# EasyEDA Pro project project.epro, board PCB
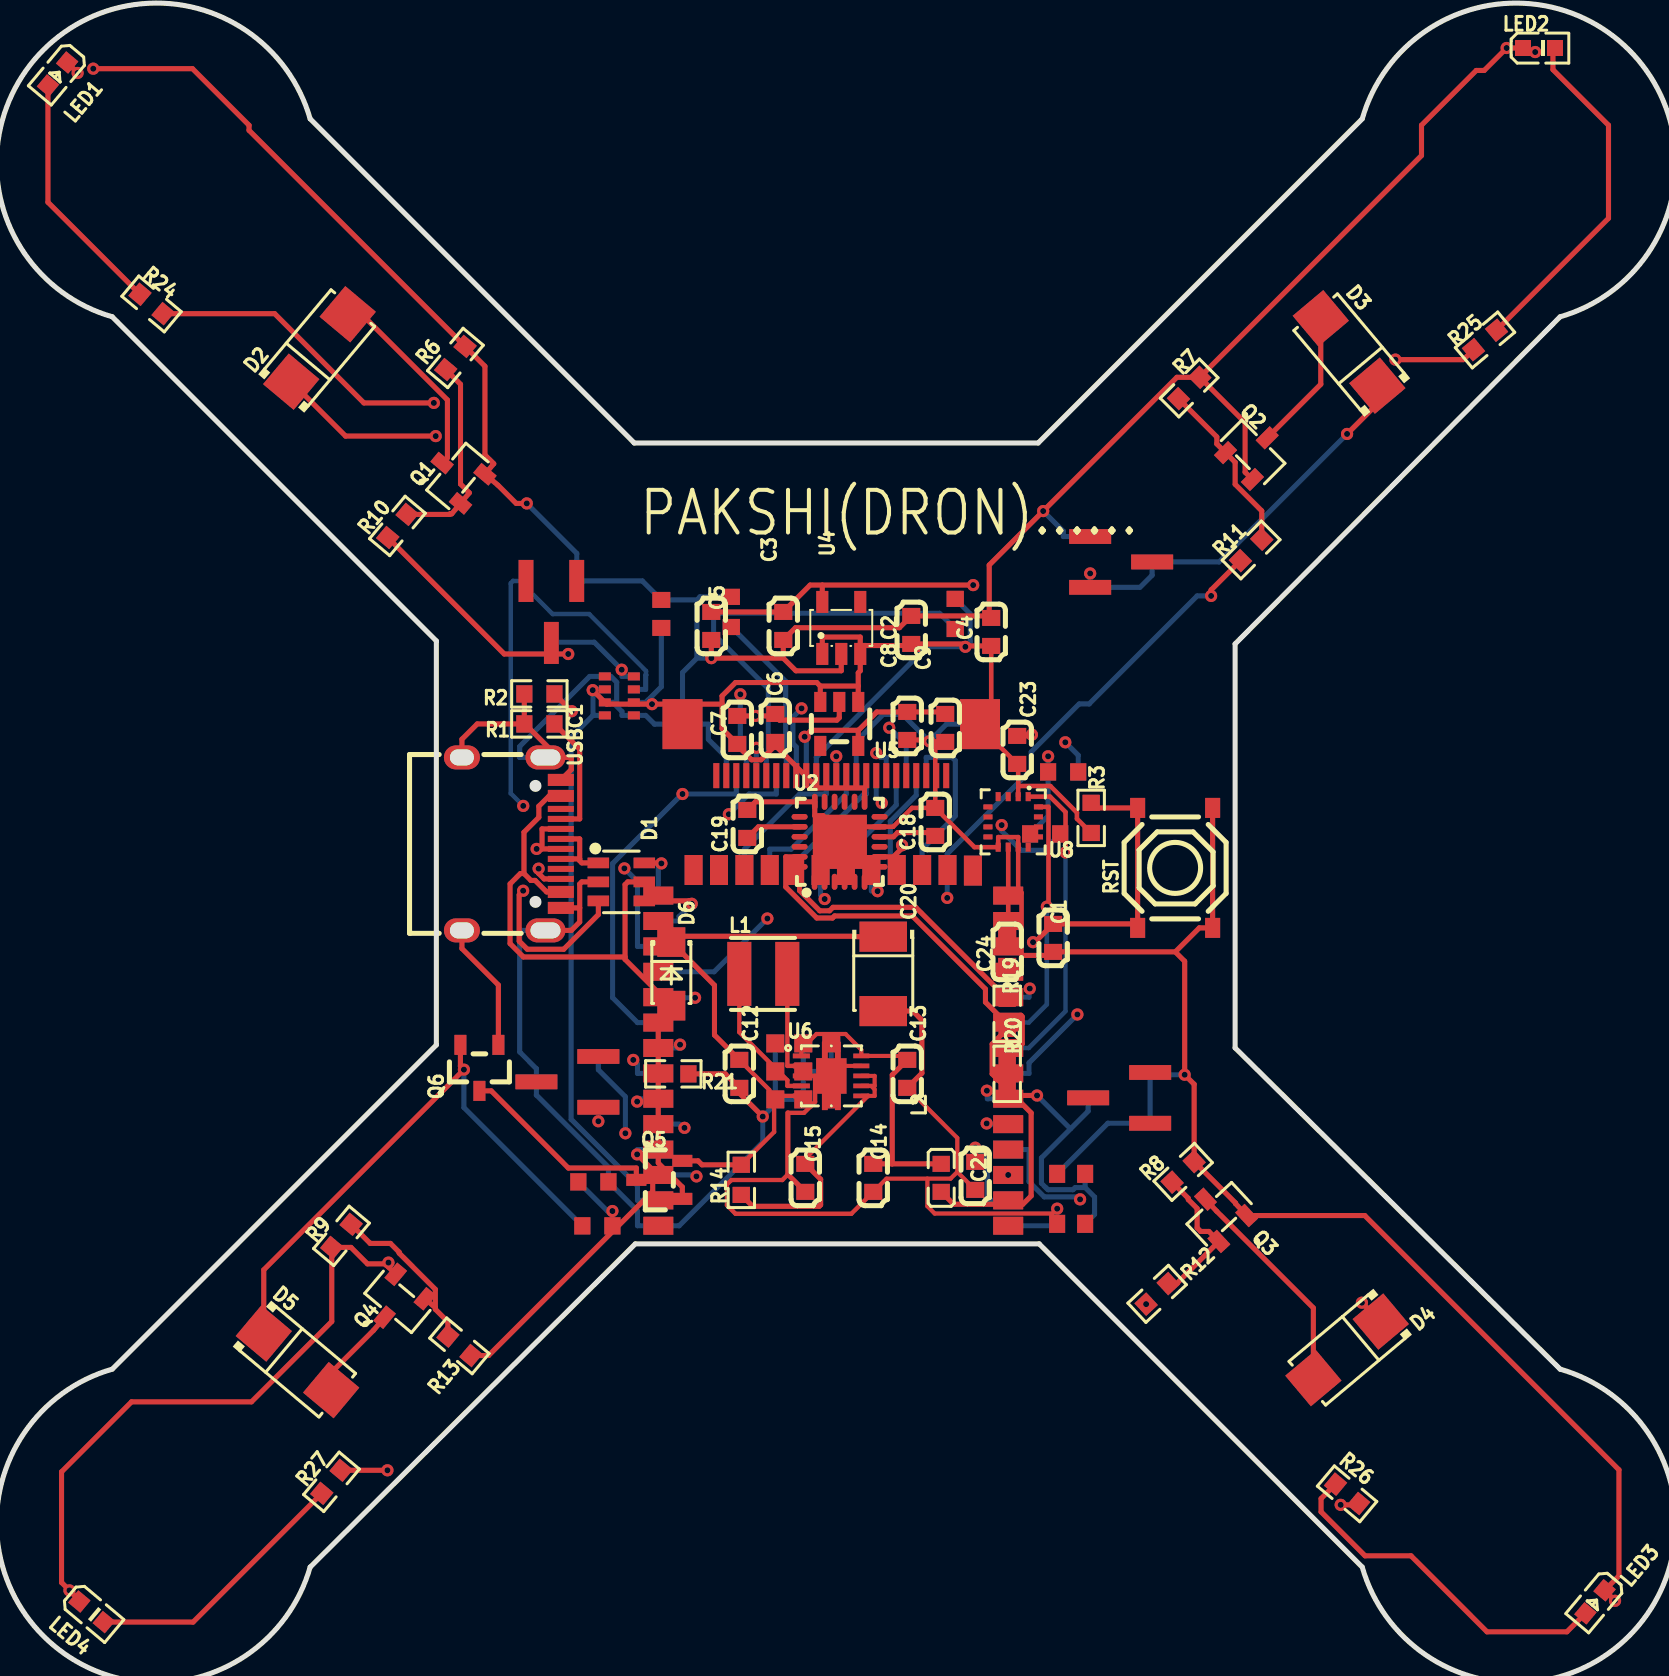
[diagram p1: board, top side]
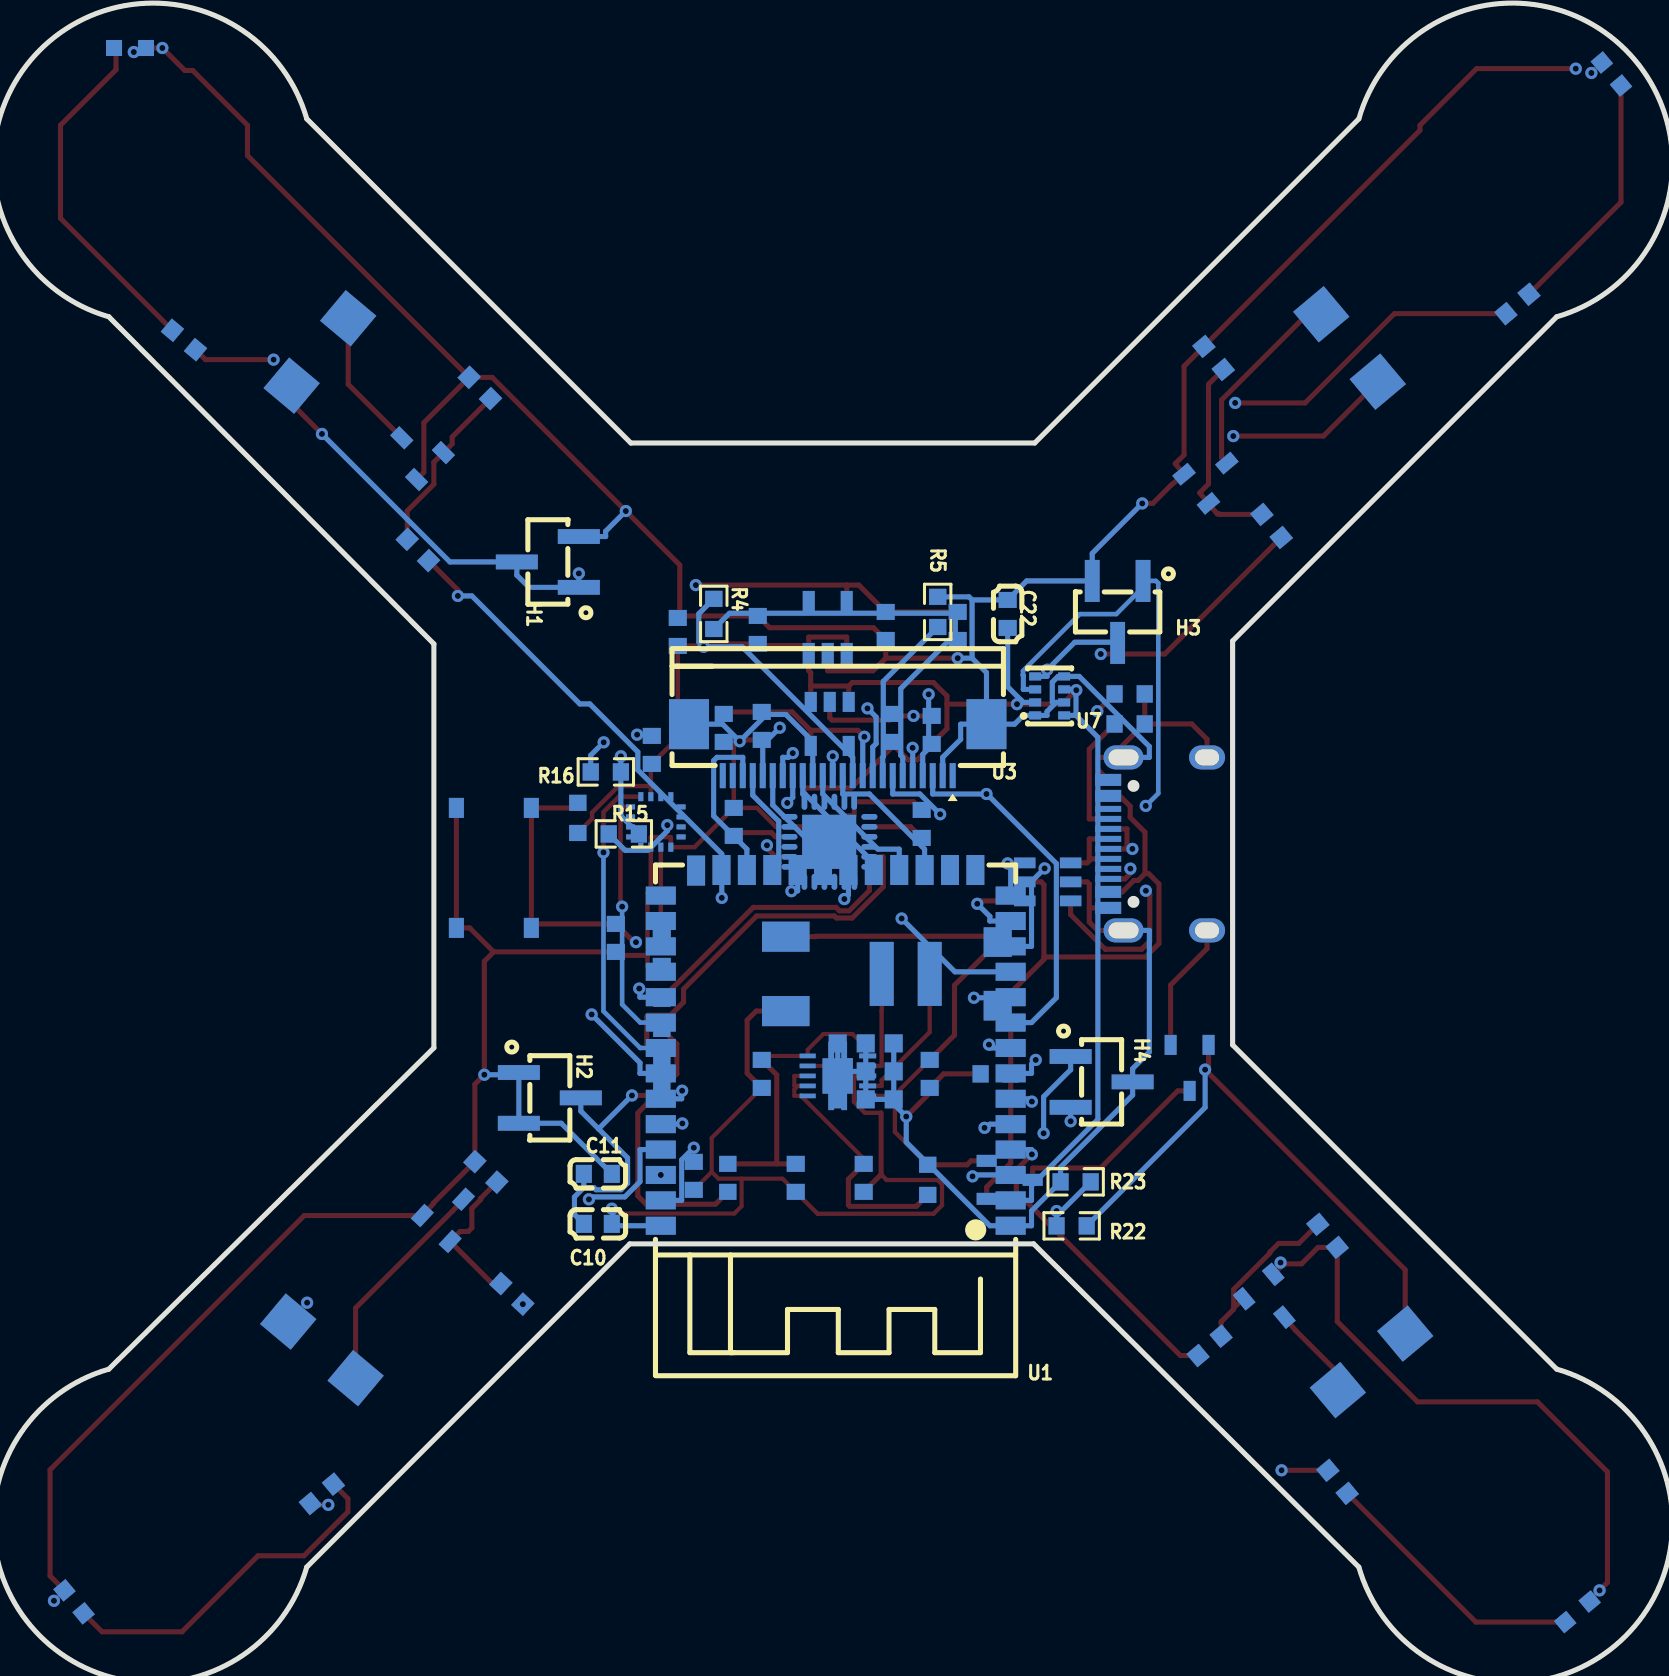
[diagram p2: board, bottom side, seen from below]

Outline 84 x 84 mm; copper layers: Top Layer, Inner1, Inner2, Bottom Layer. Coordinates in mm from the lower left corner of the outline.
Outline path: 5.79,68.31 arc(2.34,81.66) 15.69,78.21 31.9,62 52.1,62 68.31,78.21 arc(81.66,81.65) 78.21,68.31 61.95,51.95 61.95,31.75 78.21,15.69 arc(81.66,2.34) 68.31,5.79 52.15,21.95 31.95,21.95 15.69,5.79 arc(2.34,2.34) 5.79,15.69 22,31.9 22,52.1 5.79,68.31
Stack: Top Layer 0.035mm Outer layer thickness 1oz / Dielectric1 0.2104mm 7628 RC49% 8.6mil / Inner1 0.0152mm Inner layer thickness / Dielectric2 1.065mm 1.1mm H/HOZ Copper / Inner2 0.0152mm Inner layer thickness / Dielectric3 0.2104mm 7628 RC49% 8.6mil / Bottom Layer 0.035mm Outer layer thickness 1oz

## Design rules (mm)
spacing copperThickness1oz (default): track to track 0.102, other pairs 0.152 to 0.3
spacing copperThickness2oz: track to track 0.203, other pairs 0.152 to 0.3
track width copperThickness1oz (default): min 0.127, default 0.254, max 2.54
track width copperThickness2oz: min 0.203, default 0.254, max 2.54
differential pair differentialPair (default): width min 0.127, default 0.254, max 2.54; gap min 0.152, default 0.152

## Placement (name value [footprint] x y rotation side)
C1  100nF  [C0603]  52.85 37.25 270 top
C2  100nF  [C0603]  45.75 52.65 90 top
C3  100nF  [C0603]  39.35 52.85 270 top
C4  10uF  [C0603]  49.75 52.55 90 top
C5  10uF  [C0603]  35.75 52.85 270 top
C6  100nF  [C0603]  38.95 47.75 90 top
C7  10uF  [C0603]  37.05 47.65 90 top
C8  100nF  [C0603]  45.55 47.85 270 top
C9  10uF  [C0603]  47.45 47.75 270 top
C10  100nF  [C0603]  53.75 22.95 180 bottom
C11  10uF  [C0603]  53.75 25.45 180 bottom
C12  10uF  [C0603]  37.15 30.45 270 top
C13  10uF  [C0603]  45.55 30.45 270 top
C14  10uF  [C0603]  43.85 25.25 270 top
C15  100nF  [C0603]  40.45 25.25 270 top
C18  100nF  [C0603]  46.95 43.05 90 top
C19  2.2nF  [C0603]  37.55 42.95 90 top
C20  100uF  [CASE-B_3528]  44.35 35.45 270 top
C21  100nF  [C0603]  48.95 25.35 270 top
C22  100nF  [C0603]  33.25 53.45 90 bottom
C23  100nF  [C0603]  51.05 46.65 270 top
C24  10uF  [C0603]  50.55 36.55 90 top
D1  USBLC6-2SC6  [SOT-23-6_L2.9-W1.6-P0.95-LS2.8-BL]  31.25 40.05 270 top
D2  SS14  [SMA_L4.3-W2.6-LS5.2-RD]  16.15 66.75 50 top
D3  SS14  [SMA_L4.3-W2.6-LS5.2-RD]  67.65 66.55 130 top
D4  SS14  [SMA_L4.3-W2.6-LS5.2-RD]  67.55 16.65 220 top
D5  SS14  [SMA_L4.3-W2.6-LS5.2-RD]  15.05 16.05 320 top
D6  SS24L  [SOD-123FL_L2.8-W1.8-LS3.7-R-RD]  33.75 35.45 270 top
H1  B12720520-3PB0514-H10C43  [HDR-SMD_3P-P1.27-V-M-LS4.2_X1311WVS-R2]  56.25 56.05 90 bottom
H2  B12720520-3PB0514-H10C43  [HDR-SMD_3P-P1.27-V-M-LS4.2_X1311WVS-R2]  56.15 29.25 270 bottom
H3  B12720520-3PB0514-H10C43  [HDR-SMD_3P-P1.27-V-M-LS4.2_X1311WVS-R2]  27.75 53.55 0 bottom
H4  B12720520-3PB0514-H10C43  [HDR-SMD_3P-P1.27-V-M-LS4.2_X1311WVS-R2]  28.55 30.05 270 bottom
L1  2.2uH  [IND-SMD_L3.0-W3.0_SMNR3015]  38.35 35.45 0 top
L2  BLM18HB121SN1D  [L0603]  47.25 25.25 270 top
LED1  XL-1608SURC-06  [LED0603-RD_RED]  3.05 80.45 230 top
LED2  19-219/GHC-YR2T1B5Y/3T  [LED-SMD_L1.6-W0.8_19-219-GHC-YR2T1B5Y-3T]  77.15 81.75 0 top
LED3  XL-1608SURC-06  [LED0603-RD_RED]  79.95 4.05 230 top
LED4  19-219/GHC-YR2T1B5Y/3T  [LED-SMD_L1.6-W0.8_19-219-GHC-YR2T1B5Y-3T]  4.75 3.55 320 top
Q1  AO3400A  [SOT-23-3_L2.9-W1.3-P1.90-LS2.4-BR]  23.05 60.35 320 top
Q2  AO3400A  [SOT-23-3_L2.9-W1.3-P1.90-LS2.4-BR#2]  62.85 61.55 225 top
Q3  AO3400A  [SOT-23-3_L2.9-W1.3-P1.90-LS2.4-BR#2]  61.15 23.45 313 top
Q4  AO3400A  [SOT-23-3_L2.9-W1.3-P1.90-LS2.4-BR]  20.05 19.05 50 top
Q5  AO3401A  [SOT-23_L2.9-W1.3-P1.90-LS2.4-BR]  33.15 25.15 0 top
Q6  AO3401A  [SOT-23_L2.9-W1.3-P1.90-LS2.4-BR]  24.15 30.75 90 top
R1  5.1kΩ  [R0603]  27.15 47.95 0 top
R2  5.1kΩ  [R0603]  27.15 49.45 0 top
R3  10kΩ  [R0603]  54.75 43.25 270 top
R4  10kΩ  [R0603]  47.95 53.45 270 bottom
R5  10kΩ  [R0603]  36.75 53.55 270 bottom
R6  10kΩ  [R0603]  22.95 66.25 230 top
R7  10kΩ  [R0603]  59.65 64.75 225 top
R8  10kΩ  [R0603]  59.35 25.55 223 top
R9  10kΩ  [R0603]  17.25 22.35 50 top
R10  100Ω  [R0603]  20.05 57.85 50 top
R11  100Ω  [R0603]  62.75 56.65 45 top
R12  100Ω  [R0603]  58.05 19.45 43 top
R13  100Ω  [R0603]  23.15 16.85 140 top
R14  100Ω  [R0603]  37.25 25.15 90 top
R15  4.7kΩ  [R0603]  52.45 42.45 180 bottom
R16  4.7kΩ  [R0603]  53.35 45.55 180 bottom
R19  4.7kΩ  [R0603]  50.55 33.45 270 top
R20  4.7kΩ  [R0603]  50.55 30.45 270 top
R21  10kΩ  [R0603]  33.85 30.45 180 top
R22  100kΩ  [R0603]  30.05 22.85 180 bottom
R23  100kΩ  [R0603]  29.85 25.05 180 bottom
R24  100Ω  [R0603]  7.75 68.95 320 top
R25  100Ω  [R0603]  74.45 67.15 220 top
R26  100Ω  [R0603]  67.55 9.45 320 top
R27  100Ω  [R0603]  16.75 10.05 50 top
RST  TS-1187A-B-A-B  [SW-SMD_4P-L5.1-W5.1-P3.70-LS6.5-TL_H1.5]  58.95 40.75 90 top
U1  2.4GHz  [WIRELM-SMD_ESP32-S3-WROOM-1]  41.85 31.75 0 bottom
U2  MPU-6050  [QFN-24_L4.0-W4.0-P0.50-BL-EP2.7]  42.17 42.06 0 top
U3  ZX-0.5FPC-FWX-H1.5-24P  [FPC-SMD_24P-P0.50_ZX-0.5FPC-FWX-H1.5-24P]  41.75 46.65 0 bottom
U4  ME6211C28M5G-N  [SOT-23-5_L3.0-W1.7-P0.95-LS2.8-BR]  42.25 52.75 270 top
U5  AP2121AK-1.3TRG1  [SOT-23-5_L2.9-W1.6-P0.95-LS2.8-BL]  42.15 47.95 180 top
U6  TPS63001DRCR  [VSON-10_L3.0-W3.0-P0.50-TL-EP_TPS62410DRCR]  41.76 30.35 0 top
U7  BMP280  [LGA-8_L2.5-W2.0-P0.65_AMP6127]  31.15 49.35 0 bottom
U8  QMC5883P-TR  [LGA-16_L3.0-W3.0-P0.50-BL_SQ]  50.85 43.05 180 top
USBC1  TYPE-C-31-M-12  [USB-C_SMD-TYPE-C-31-M-12_1]  25.75 41.95 270 top

## Footprints (pads in the part's own frame, mm; a bottom-side part is the same pattern mirrored in y, then rotated)
C0603
  rect 0.8x0.9 hole 0.001: 1(-0.7,0) 2(0.7,0)
CASE-B_3528
  rect 1.506x2.376 hole 0.001: 1(-1.861,0) 2(1.861,0)
FPC-SMD_24P-P0.50_ZX-0.5FPC-FWX-H1.5-24P
  rect 0.3x1.25 hole 0.001: 1(-5.75,1.288) 2(-5.25,1.288) 3(-4.75,1.288) 4(-4.25,1.288) 5(-3.75,1.288) 6(-3.25,1.288) 7(-2.75,1.288) 8(-2.25,1.288) 9(-1.75,1.288) 10(-1.25,1.288) 11(-0.75,1.288) 12(-0.25,1.288) 13(0.25,1.288) 14(0.75,1.288) 15(1.25,1.288) 16(1.75,1.288) 17(2.25,1.288) 18(2.75,1.288) 19(3.25,1.288) 20(3.75,1.288) 21(4.25,1.288) 22(4.75,1.288) 23(5.25,1.288) 24(5.75,1.288)
  rect 2x2.5 hole 0.001: 25(7.44,-1.288) 26(-7.44,-1.288)
HDR-SMD_3P-P1.27-V-M-LS4.2_X1311WVS-R2
  rect 0.74x2.1 hole 0.001: 1(-1.27,-1.55) 2(0,1.55) 3(1.27,-1.55)
IND-SMD_L3.0-W3.0_SMNR3015
  rect 1.2x3.2 hole 0.001: 1(-1.2,0) 2(1.2,0)
L0603
  rect 0.8x0.864 hole 0.001: 1(-0.7,0) 2(0.7,0)
LED0603-RD_RED
  rect 0.8x0.8 hole 0.001: 1(-0.749,-0.004) 2(0.749,0.004)
LED-SMD_L1.6-W0.8_19-219-GHC-YR2T1B5Y-3T
  rect 0.8x0.8 hole 0.001: 1(0.799,0) 2(-0.799,0)
LGA-8_L2.5-W2.0-P0.65_AMP6127
  rect 0.6x0.4 hole 0.001: 1(0.725,0.975) 2(0.725,0.325) 3(0.725,-0.325) 4(0.725,-0.975) 5(-0.725,-0.975) 6(-0.725,-0.325) 7(-0.725,0.325) 8(-0.725,0.975)
LGA-16_L3.0-W3.0-P0.50-BL_SQ
  rect 0.25x0.45 hole 0.001: 1(-0.75,-1.263) 2(-0.25,-1.263) 3(0.25,-1.263) 4(0.75,-1.263) 9(0.75,1.263) 10(0.25,1.263) 11(-0.25,1.263) 12(-0.75,1.263)
  rect 0.45x0.25 hole 0.001: 5(1.263,-0.75) 6(1.263,-0.25) 7(1.263,0.25) 8(1.263,0.75) 13(-1.263,0.75) 14(-1.263,0.25) 15(-1.263,-0.25) 16(-1.263,-0.75)
QFN-24_L4.0-W4.0-P0.50-BL-EP2.7
  oval 0.28x0.8 hole 0.001: 1(-1.25,-2) 2(-0.75,-2) 3(-0.25,-2) 4(0.25,-2) 5(0.75,-2) 6(1.25,-2) 13(1.25,2) 14(0.75,2) 15(0.25,2) 16(-0.25,2) 17(-0.75,2) 18(-1.242,2)
  oval 0.8x0.28 hole 0.001: 7(2,-1.25) 8(2,-0.75) 9(2,-0.25) 10(2,0.25) 11(2,0.75) 12(2,1.25) 19(-2,1.25) 20(-2,0.75) 21(-2,0.25) 22(-2,-0.25) 23(-2,-0.75) 24(-2,-1.25)
  rect 2.7x2.7 hole 0.001: 25(0.013,0)
R0603
  rect 0.806x0.864 hole 0.001: 1(-0.753,0) 2(0.753,0)
SMA_L4.3-W2.6-LS5.2-RD
  rect 2x2 hole 0.001: 1(-2.2,0) 2(2.2,0)
SOD-123FL_L2.8-W1.8-LS3.7-R-RD
  rect 1.48x1.4 hole 0.001: 1(1.59,0) 2(-1.59,0)
SOT-23-3_L2.9-W1.3-P1.90-LS2.4-BR
  rect 1x0.65 hole 0.001: 1(1,-0.95) 2(1,0.95) 3(-1,0)
SOT-23-3_L2.9-W1.3-P1.90-LS2.4-BR#2
  rect 1x0.65 hole 0.001: 1(1,-0.95) 2(1,0.95) 3(-1,0)
SOT-23-5_L2.9-W1.6-P0.95-LS2.8-BL
  rect 0.6x1 hole 0.001: 1(-0.95,-1.1) 2(0,-1.1) 3(0.95,-1.1) 4(0.95,1.1) 5(-0.95,1.1)
SOT-23-5_L3.0-W1.7-P0.95-LS2.8-BR
  rect 1.1x0.6 hole 0.001: 1(1.3,-0.95) 2(1.3,0) 3(1.3,0.95) 4(-1.3,0.95) 5(-1.3,-0.95)
SOT-23-6_L2.9-W1.6-P0.95-LS2.8-BL
  rect 0.532x1.072 hole 0.001: 1(-0.95,-1.149) 2(0,-1.149) 3(0.95,-1.149) 4(0.95,1.149) 5(0,1.149) 6(-0.95,1.149)
SOT-23_L2.9-W1.3-P1.90-LS2.4-BR
  rect 1x0.6 hole 0.001: 1(1.15,-0.95) 2(1.15,0.95) 3(-1.15,0)
SW-SMD_4P-L5.1-W5.1-P3.70-LS6.5-TL_H1.5
  rect 1x0.75 hole 0.001: 1(-3,1.875) 2(3,1.875) 3(-3,-1.875) 4(3,-1.875)
USB-C_SMD-TYPE-C-31-M-12_1
  oval 1.2x2 hole 0.8x1.5: 1(4.325,1.706) 4(-4.325,1.706)
  oval 1.2x1.8 hole 0.8x1.2: 2(4.325,-2.474) 3(-4.325,-2.474)
  custom 0.6x1.3 hole 0.001: A1B12(-3.2,2.474) A4B9(-2.4,2.474) B1A12(3.2,2.474) B4A9(2.401,2.474)
  rect 0.3x1.3 hole 0.001: A5(-1.25,2.474) A6(-0.25,2.474) A7(0.25,2.474) A8(1.25,2.474) B5(1.75,2.474) B6(0.75,2.474) B7(-0.75,2.474) B8(-1.75,2.474)
VSON-10_L3.0-W3.0-P0.50-TL-EP_TPS62410DRCR
  rect 0.85x0.24 hole 0.001: 1(-1.5,1) 2(-1.5,0.5) 3(-1.5,0) 4(-1.5,-0.5) 5(-1.5,-1)
  rect 0.8x0.23 hole 0.001: 6(1.5,-1) 7(1.5,-0.5) 8(1.5,0) 9(1.5,0.5) 10(1.5,1)
  custom 1.52x3.42 hole 0.001: 11(0,-0.005)
WIRELM-SMD_ESP32-S3-WROOM-1
  rect 1.5x0.9 hole 0.001: 1(-8.75,8.895) 2(-8.75,7.625) 3(-8.75,6.355) 4(-8.75,5.085) 5(-8.75,3.815) 6(-8.75,2.545) 7(-8.75,1.275) 8(-8.75,0.005) 9(-8.75,-1.265) 10(-8.75,-2.535) 11(-8.75,-3.805) 12(-8.75,-5.075) 13(-8.75,-6.345) 14(-8.75,-7.615) 27(8.75,-7.615) 28(8.75,-6.345) 29(8.75,-5.075) 30(8.75,-3.805) 31(8.75,-2.535) 32(8.75,-1.265) 33(8.75,0.005) 34(8.75,1.275) 35(8.75,2.545) 36(8.75,3.815) 37(8.75,5.085) 38(8.75,6.355) 39(8.75,7.625) 40(8.75,8.895)
  rect 0.9x1.5 hole 0.001: 15(-6.985,-8.895) 16(-5.715,-8.895) 17(-4.445,-8.895) 18(-3.175,-8.895) 19(-1.905,-8.895) 20(-0.635,-8.895) 21(0.635,-8.895) 22(1.905,-8.895) 23(3.175,-8.895) 24(4.445,-8.895) 25(5.715,-8.895) 26(6.985,-8.865)
  rect 0.9x0.9 hole 0.001: 41(-2.9,-0.225) 41(-2.9,1.175) 41(-2.9,2.575) 41(-1.5,-0.225) 41(-1.5,1.175) 41(-1.5,2.575) 41(-0.1,-0.225) 41(-0.1,1.175) 41(-0.1,2.575)

## Nets
As in the schematic.

Pads without a net: U1 15 16 26 27 28 29 30; U2 2 3 4 5 6 7 9 12 14 15 16 17 19 21 22; U3 1 23 24; U4 4; U5 4; U8 3 4 5 6 7 8 12 13 14 15; USBC1 A8 B8

## Via types
v1: diameter 0.61, hole 0.305, Top Layer to Bottom Layer, 80 vias

## Routing (per net, layer and track width the routed paths; a pad name or vN(x,y) marks a point on that pad's centre or on a via; arc(x,y) is an arc through that point)
+1.3V: length 10.3
  Top Layer w0.254: C9.1 47.35,48.55 C8.1 44.03,48.55 43.1,47.62 ; U5.5 43.1,47.62 ; 43.1,47.62 43.09,47.63 40.75,47.63 v1(40.42,47.31)
  Bottom Layer w0.254: v1(40.42,47.31) 40.5,47.23 U3.10
+2.8V: length 47.3
  Top Layer w0.254: U4.5 41.3,54.89 ; 41.3,54.89 v1(48.85,54.89) ; 41.3,54.89 40.69,54.89 C3.1 C5.1
  Inner1 w0.254: v1(52.6,46.33) 52.03,46.33 51.13,47.22 51.13,52.61 v1(48.85,54.89)
  Inner2 w0.254: v1(48.85,54.89) 42.66,54.89 v1(37.2,49.43)
  Bottom Layer w0.254: v1(52.6,46.33) 52.6,43.35 R15.2 ; U3.4 37.5,46.42 37.2,46.72 v1(37.2,49.43)
GND: length 477
  Top Layer w0.206: 46.56,25.21 44.51,25.21 C14.2 ; 46.56,25.21 46.56,23.83 46.92,23.47 52.81,23.47 v1(53.05,23.71) ; 46.56,25.21 47.72,25.21 48.05,25.55 ; C13.2 48.05,27.25 48.05,25.55 ; 43.25,30.85 42.26,30.85 U6.11 ; 48.05,25.55 C21.2
  Top Layer w0.215: 40.93,30.35 40.95,30.35 40.96,30.34 U6.11 ; 40.93,30.35 40.94,30.33 40.94,29.05 40.39,28.5 39.58,28.5 ; 40.93,30.35 U6.3 ; C14.2 42.75,23.45 36.96,23.45 36.53,23.88 36.53,24.92 36.75,25.14 39.3,25.14 39.58,25.42 39.58,25.45
  Top Layer w0.225: C18.2 46.95,47.05 ; C18.2 45.79,43.75 44.84,42.8 U2.11 ; C18.2 48.91,41.79 U8.9 50.1,42.29 51.1,42.29 U8.11 51.1,39.67 51.27,39.51 51.27,35.85
  Top Layer w0.254: 19.97,20.43 19.6,20.79 v1(19.6,21.01) 19.54,20.95 18.55,20.95 17.73,21.77 16.77,21.77 16.77,18.07 12.75,14.05 6.75,14.05 3.25,10.55 3.25,5.02 v1(3.64,4.62) 4.14,4.13 LED4.2 ; 39.35,51.24 39.98,50.61 42.25,50.61 U4.2 ; 39.35,51.24 C3.2 39.96,52.76 45.16,52.76 C2.2 49.65,53.35 ; 39.35,51.24 v1(35.75,51.24) C5.2 ; 62.81,60.17 62.45,60.54 62.45,63.02 R7.1 ; R1.1 R2.1 ; R1.1 26.43,47.95 28.1,46.27 ; R1.1 24.04,47.95 23.28,47.18 23.28,46.27 ; v1(51.79,47.41) 51.72,47.35 C23.1 ; 38.95,48.35 v1(37.96,48.35) C7.2 ; 38.95,48.35 C6.2 ; 38.95,48.35 39.16,48.14 42.03,48.14 42.15,48.26 U5.2 ; 42.18,42.52 U2.25 40.92,40.79 U2.1 ; 42.18,42.52 41.34,43.36 40.92,43.36 U2.18 37.95,44.05 C19.2 ; 42.18,42.52 42.46,42.8 U2.11 ; 51.27,36.37 52.67,36.37 C1.2 58.96,36.55 ; R7.1 59.04,65.28 v1(52.35,58.59) 49.65,55.89 49.65,53.35 ; R7.1 71.27,76.37 71.27,77.89 74.01,80.63 74.41,80.63 v1(75.53,81.75) 76.25,81.75 76.45,81.55 v1(76.96,81.55) ; v1(26.52,58.98) 25.99,58.98 25.07,59.89 Q1.2 24.87,60.96 24.43,61.4 24.43,65.83 23.43,66.83 12.63,77.63 12.63,77.89 9.8,80.71 v1(4.83,80.71) ; Q6.1 25.1,34.89 23.28,36.72 USBC1.2 ; v1(80.95,4.1) 80.43,4.63 81.15,5.35 81.15,10.65 68.43,23.37 Q3.2 61.97,23.96 61.97,23.99 R8.1 59.9,29.93 v1(59.43,30.41) 59.43,36.08 58.96,36.55 ; C8.2 46.59,47.15 v1(46.65,47.08) 46.69,47.05 C9.2 ; USBC1.1 28.75,37.62 29.17,38.04 29.17,38.75 ; v1(38.32,28.32) 37.06,29.58 37.06,29.84 ; 37.06,29.84 C12.2 ; 37.06,29.84 36.8,29.84 36.8,30.1 36.45,30.45 34.6,30.45 ; 29.17,38.75 29.17,39.94 29.27,40.05 D1.2 ; 29.17,38.75 USBC1.B1A12 ; 58.96,36.55 60.16,37.75 RST.3 RST.4 ; C24.1 51.27,35.85 ; 28.1,46.27 27.46,46.27 ; 28.1,46.27 28.75,46.27 28.75,45.67 USBC1.A1B12 ; 39.58,25.42 C15.2 ; 39.58,28.5 39.58,25.45 ; 49.65,53.35 C4.2 ; 3.53,81.03 v1(4.05,80.5) ; C20.2 45.83,33.59 46.28,33.14 46.28,30.48 C13.2
  Inner1 w0.225: v1(51.79,47.41) 51.79,58.03 v1(52.35,58.6)
  Inner1 w0.254: v1(37.96,48.35) 37.96,49.5 36.23,51.24 v1(35.75,51.24) ; v1(19.6,21.01) 19.6,28.47 23.28,32.15 USBC1.2 23.28,46.27 ; v1(4.83,80.71) 4.27,80.71 v1(4.05,80.5) ; v1(53.05,23.71) 53.05,24.03 v1(59.43,30.41)
  Inner2 w0.254: v1(46.66,47.08) 46.99,47.41 v1(51.79,47.41) ; USBC1.1 USBC1.2
  Bottom Layer w0.254: 57.7,30.41 H2.3 55.58,27.98 C11.2 ; 57.7,30.41 H2.1 ; 57.7,30.41 v1(59.43,30.41) ; U1.41 40.35,29.18 38.95,29.18 ; U1.41 40.35,31.98 ; U1.41 U1.41 ; 35.03,51.24 v1(35.75,51.24) ; 35.03,51.24 35.03,54.15 ; 35.03,51.24 34.31,50.52 U3.26 ; 38.95,29.18 U1.41 38.95,31.98 ; 38.95,29.18 38.95,28.94 v1(38.32,28.32) 38.32,27.04 34.14,22.85 U1.1 32.06,22.85 32.06,23.6 R23.1 30.6,25.78 27,29.39 H4.2 27,30.71 26.16,31.55 26.16,37.62 USBC1.1 ; 35.03,54.15 C22.2 32.3,55.1 H3.3 29.02,56.48 v1(26.52,58.98) ; 35.03,54.15 35.18,54.3 R5.1 ; v1(52.35,58.59) 53.36,57.59 53.36,57.32 H1.3 ; U1.41 41.75,29.18 ; U1.41 41.75,31.98 ; 53,22.9 C10.2 ; 53,22.9 52.95,22.85 U1.40 ; 53,22.9 53,23.66 v1(53.05,23.71) ; U3.25 47.51,47.94 v1(46.65,47.08) 45.31,48.42 44.35,48.42 43,47.08 U3.15 ; 30.82,49.02 31.28,48.57 31.28,48.37 U7.1 32.47,48.37 32.9,47.94 U3.26 ; 30.82,49.02 U7.7 ; 30.82,49.02 31.02,49.02 31.02,50.04 30.73,50.32 29.67,50.32 26.16,46.82 26.16,46.27 27.46,46.27 ; U3.2 36.5,46.28 35.6,47.18 35.6,47.94 U3.26
VBAT: length 177.4
  Top Layer w0.254: v1(67.55,62.45) 69.06,63.96 69.06,64.86 ; D2.1 17.46,62.34 v1(21.97,62.34) ; Q6.2 23.2,30.84 v1(23.37,30.66) 13.36,20.65 13.36,17.46 ; D4.1 v1(68.29,19.01)
  Inner1 w0.254: v1(21.97,62.35) 24.59,59.72 24.59,31.88 v1(23.38,30.66)
  Inner2 w0.254: v1(68.29,19.01) 56.97,30.33 23.7,30.33 v1(23.37,30.66) ; v1(21.97,62.34) 28.8,55.51 54.67,55.51 v1(54.7,55.48)
  Bottom Layer w0.254: v1(23.37,30.66) 23.37,28.77 R22.2 ; v1(67.55,62.45) 61.15,56.05 H1.2 57.8,55.39 57.19,54.78 H1.1 v1(54.7,55.48)
VCC: length 157
  Top Layer w0.225: 51.1,44.84 51.1,45.9 C23.2 49.75,47.25 C4.1 ; 51.1,44.84 U8.2 ; 51.1,44.84 52.71,44.84 54.04,43.51 54.04,43.21 R3.2
  Top Layer w0.254: 50.88,29.37 R20.2 49.8,30.45 49.8,31.94 R19.2 ; 50.88,29.37 51.75,28.5 51.75,24.35 51.33,23.93 47.87,23.93 L2.2 ; 50.88,29.37 v1(52.04,29.37) ; v1(45.29,41.88) 45.29,41.74 44.86,41.3 U2.8 ; U2.13 43.42,44.75 41.07,44.75 38.95,46.87 ; 43.1,49.84 41.2,49.84 ; 43.1,49.84 U5.1 ; 43.1,49.84 43.1,50.51 43.2,50.61 U4.3 43.2,51.87 ; 41.2,49.84 U5.3 ; 41.2,49.84 41.02,50.02 36.96,50.02 36.29,49.35 36.29,48.94 ; 48.46,51.85 v1(48.46,51.81) ; 48.46,51.85 C4.1 ; 48.46,51.85 48.36,51.95 C2.1 45.67,51.87 43.2,51.87 ; 38.95,46.87 38.24,46.16 37.76,46.16 37.05,46.87 C7.1 36.29,47.71 36.29,48.94 ; 38.95,46.87 C6.1 ; 43.2,51.87 43.2,52.29 41.3,52.29 U4.1 ; 36.29,48.94 v1(32.78,48.94) 30.52,48.94 v1(29.82,49.64)
  Inner1 w0.254: 47.81,41.93 52.46,37.27 52.46,29.79 v1(52.04,29.37) ; 47.81,41.93 48.46,42.58 v1(48.46,51.81) ; 47.81,41.93 45.34,41.93 v1(45.29,41.88)
  Bottom Layer w0.254: 53.71,27.7 v1(52.04,29.37) ; 53.71,27.7 52.26,26.25 52.26,24.98 52.59,24.66 53.85,24.66 53.95,24.76 54.45,24.76 ; 53.71,27.7 54.6,28.59 H2.2 ; U7.8 29.83,48.37 ; 29.83,48.37 28.74,47.28 28.74,28.18 32.06,24.86 32.06,24.12 U1.2 ; 29.83,48.37 29.83,49.64 ; 29.83,49.64 v1(29.82,49.64) ; 29.83,49.64 29.87,49.67 U7.6 ; 32.58,49.14 32.47,49.02 U7.2 ; 32.58,49.14 v1(32.78,48.94) ; 32.58,49.14 33.25,49.81 C22.1 ; 54.45,24.76 C11.1 ; 54.45,24.76 54.92,24.29 54.92,23.42 C10.1 ; R4.1 48.7,53.45 48.7,52.05 v1(48.46,51.81) 46.53,51.81 41,46.28 U3.11
VIN: length 29.3
  Top Layer w0.215: 38.65,29.35 38.89,29.11 38.89,27.54 37.25,25.9 ; 38.65,29.35 38.65,29.65 C12.1 ; 38.65,29.35 U6.5
  Top Layer w0.254: C20.1 42.87,37.31 42.85,37.33 34.04,37.33 D6.2 35.91,34.88 35.91,32.39 C12.1 ; Q5.2 35.09,26.1 35.28,25.9 37.25,25.9
D_N: length 13.7
  Top Layer w0.254: v1(26.34,39.61) 26.14,39.41 26.14,37.09 26.54,36.68 28.37,36.68 30.1,38.42 D1.3 ; USBC1.B7 27.28,42.7 27.28,41.7 ; v1(27.01,41.7) 27.28,41.7 ; 27.28,41.7 USBC1.A7
  Inner1 w0.254: v1(26.34,39.61) 26.34,41.03 v1(27.02,41.7)
D_P: length 4
  Top Layer w0.254: D1.1 29.27,41 29.17,41.11 29.17,41.2 ; 29.17,41.2 29.17,42.2 USBC1.A6 ; 29.17,41.2 USBC1.B6
EN: length 38
  Top Layer w0.254: 57.07,37.95 RST.1 ; 57.07,37.95 RST.2 55,43.75 54.75,44 ; 57.07,37.95 C1.1 51.94,37.04 v1(51.84,37.04)
  Inner1 w0.254: v1(51.85,37.04) 46.21,37.04 35.01,25.83 v1(35.01,25.33)
  Bottom Layer w0.254: v1(35.01,25.33) 34.94,25.4 U1.3
IO1: length 27.1
  Top Layer w0.254: C21.1 v1(48.95,26.76)
  Inner2 w0.254: v1(30.81,23.59) 33.97,26.76 v1(48.95,26.76)
  Bottom Layer w0.254: v1(48.95,26.76) 49.56,26.15 49.56,24.12 U1.39 ; R23.2 30.55,23.59 v1(30.8,23.59) R22.1
IO2: length 9.8
  Inner2 w0.254: v1(50.6,25.39) 50.6,25 56.66,18.94 v1(57.5,18.94)
IO4: length 16
  Top Layer w0.254: 23.73,16.37 24.61,16.37 32.82,24.57 32.82,25.65 v1(32.04,26.42)
  Bottom Layer w0.254: U1.4 32.06,26.67 32.06,26.45 v1(32.04,26.43)
IO5: length 27
  Top Layer w0.254: 17.24,10.63 v1(19.55,10.63)
  Inner1 w0.254: v1(19.55,10.63) 34.41,25.48 v1(34.41,27.75)
  Bottom Layer w0.254: U1.5 34.14,27.94 34.33,27.76 v1(34.41,27.76)
IO6: length 55.7
  Top Layer w0.254: v1(21.87,64) 18.37,64 13.91,68.47 8.33,68.47
  Inner1 w0.254: v1(32.04,29.07) 25.75,35.36 25.75,60.13 v1(21.87,64)
  Bottom Layer w0.254: v1(32.04,29.06) 32.06,29.08 32.06,29.2 U1.6
IO7: length 19.8
  Inner1 w0.254: v1(31.85,31.15) 31.85,38.66 v1(36.63,43.44)
  Bottom Layer w0.254: v1(31.85,31.15) 32.06,30.94 32.06,30.47 U1.7 ; U3.7 39,44.44 37.64,44.44 v1(36.63,43.43)
IO8: length 28.5
  Top Layer w0.254: v1(28.59,51.45) 25.39,51.45 19.57,57.27
  Inner1 w0.254: v1(28.59,51.45) 28.59,49.81 31.4,47 v1(31.4,40.73)
  Bottom Layer w0.254: v1(31.4,40.73) 32.06,40.07 32.06,36.82 U1.12
IO9: length 7.2
  Bottom Layer w0.254: U1.17 37.41,41.69 40.17,44.45 41.5,44.45 U3.12
IO10: length 6.9
  Bottom Layer w0.254: U3.14 42.5,44.45 39.74,41.69 38.68,41.69 U1.18
IO11: length 6.3
  Bottom Layer w0.254: U3.16 43.5,44.44 43.39,44.44 39.94,41 U1.19
IO12: length 11.4
  Inner1 w0.254: v1(41.42,39.2) 43.69,41.46 43.69,46.18 v1(44,46.49)
  Bottom Layer w0.254: v1(44,46.49) 44.21,46.28 44.5,46.28 U3.18 ; 41.21,40.64 41.21,39.4 v1(41.42,39.19)
IO13: length 5.9
  Bottom Layer w0.254: U1.21 42.48,41.69 42.8,41.69 45,43.89 U3.19
IO14: length 12.7
  Inner1 w0.254: v1(44.07,39.59) 44.07,42.96 44.87,43.76 44.87,47.55 v1(44.65,47.76)
  Bottom Layer w0.254: v1(44.65,47.76) 45.5,46.91 U3.20 ; U1.22 43.76,39.61 44.05,39.61 v1(44.07,39.59)
IO15: length 26.4
  Inner1 w0.254: v1(34.19,31.91) 39.45,37.18 39.45,42.07 42.7,45.31 42.7,46.63 40.6,48.73 v1(40.26,48.73)
  Bottom Layer w0.254: v1(40.27,48.73) 39.83,48.3 39.83,46.97 40,46.8 U3.9 ; v1(34.19,31.91) 34.14,31.87 34.14,31.75 U1.8
IO16: length 38.7
  Inner2 w0.254: v1(50.27,42.89) 48.58,44.59 34.45,44.59 v1(34.31,44.44)
  Bottom Layer w0.254: U1.9 32.06,33.01 30.81,34.26 30.81,40.97 34.29,44.44 v1(34.31,44.44) 37,44.44 U3.3 ; R15.1 52.38,41.63 51.25,41.63 50.27,42.6 v1(50.27,42.89)
IO17: length 35.5
  Inner1 w0.254: v1(34.94,34.26) 37.97,37.29 37.97,46.72 v1(38,46.75)
  Inner2 w0.254: v1(38.01,46.76) 39.2,47.95 43.41,47.95 43.91,48.45 52.04,48.45 v1(53.46,47.03)
  Bottom Layer w0.254: v1(34.94,34.26) 34.17,34.26 34.14,34.28 U1.10 ; v1(38,46.75) 38,46.75 U3.5 ; v1(53.46,47.03) 54.1,46.38 R16.1
IO18: length 17.1
  Inner1 w0.254: v1(42,46.33) 38.55,42.89 v1(38.55,38.22)
  Bottom Layer w0.254: 33.1,35.55 35.89,35.55 v1(38.55,38.22) ; U3.13 v1(42,46.33)
IO19: length 4.6
  Top Layer w0.254: D1.4 34.63,39.1 v1(34.77,38.96)
  Bottom Layer w0.254: v1(34.77,38.95) 34.14,38.33 34.14,38.09 U1.13
IO20: length 2.5
  Top Layer w0.254: v1(33.26,40.98) 33.23,41 D1.6
  Bottom Layer w0.254: U1.14 33.1,40.82 v1(33.26,40.98)
IO21: length 5.4
  Bottom Layer w0.254: U1.23 44.7,40.97 44.7,43.08 46,44.38 U3.21
IO38: length 18.9
  Inner2 w0.254: v1(44.28,44) 48.32,44 53.13,39.2 53.13,36.16 v1(51.68,34.72)
  Bottom Layer w0.254: v1(44.28,44) 44,44.27 U3.17 ; U1.31 51.64,34.28 51.64,34.68 v1(51.68,34.72)
IO39: length 62.9
  Top Layer w0.225: U8.16 52.62,43.8 52.62,38.9 v1(52.54,38.81)
  Inner2 w0.225: v1(52.53,38.81) 50.39,40.95 36.88,40.95 33.98,43.85 v1(26.34,43.85)
  Bottom Layer w0.225: 32.48,50.39 32.48,50.6 29.64,53.44 27.81,53.44 26.16,55.1 ; U1.32 51.63,33.01 52.53,33.92 v1(52.53,38.81) ; 26.16,55.1 25.83,55.1 25.72,54.98 25.72,44.48 v1(26.34,43.85) ; 26.16,55.1 H3.1
  Bottom Layer w0.254: U7.3 32.47,49.67 32.47,50.38 32.48,50.39
IO40: length 51.5
  Top Layer w0.225: U8.1 52.7,44.32 53.47,43.54 v1(53.47,41.53)
  Inner2 w0.225: v1(31.27,50.66) 33.84,50.66 35.75,48.75 37.33,48.75 37.89,49.3 52.11,49.3 54.07,47.35 54.07,42.12 v1(53.47,41.52)
  Bottom Layer w0.225: 31.28,50.65 31.28,50.58 ; v1(53.47,41.52) 53.47,33.58 51.63,31.74 U1.33 ; 31.69,50.32 31.87,50.32 ; v1(31.27,50.66) 31.27,50.65
  Bottom Layer w0.254: 31.27,50.65 31.28,50.65 ; v1(31.27,50.66) 29.89,52.03 27.78,52.03 H3.2 ; 31.69,50.32 31.28,50.32 31.28,50.58
IO41: length 51.7
  Top Layer w0.254: v1(69.97,66.17) 73.38,66.17 73.88,66.67
  Inner1 w0.254: v1(54.06,33.42) 54.06,55.81 64.43,66.17 v1(69.97,66.17)
  Bottom Layer w0.254: v1(54.06,33.42) 51.64,31 51.64,30.47 U1.34
IO42: length 22.2
  Inner2 w0.254: v1(49.53,29.61) 35.43,29.61 33.9,28.08 v1(30.1,28.08)
  Bottom Layer w0.254: U1.35 49.56,29.21 49.56,29.59 v1(49.54,29.61) ; v1(30.1,28.08) H4.3
IO47: length 8.6
  Bottom Layer w0.254: U3.22 46.5,46.28 47.79,46.28 47.96,46.12 47.96,43.35 46.3,41.69 U1.24
IO48: length 23.6
  Top Layer w0.254: R11.1 60.75,54.65 v1(60.75,54.35)
  Bottom Layer w0.254: v1(60.75,54.35) 60.05,54.35 54.65,48.95 54.15,48.95 51.75,46.55 51.75,45.65 47.55,41.45 v1(47.55,39.25)
RX: length 24
  Inner2 w0.254: v1(49.53,27.97) 47.66,27.97 46.85,27.17 31.77,27.17 v1(31.45,27.48)
  Bottom Layer w0.254: v1(49.52,27.97) 49.56,27.93 U1.36 ; v1(31.45,27.48) 31.45,29.31 30.1,30.66 H4.1
TX: length 30.9
  Top Layer w0.254: v1(67.23,8.9) 68.06,8.9 68.13,8.97
  Inner1 w0.254: v1(54.2,24.18) 59.98,24.18 67.65,16.5 67.65,9.32 v1(67.23,8.9)
  Bottom Layer w0.254: v1(54.2,24.18) 54.08,24.3 52.4,24.3 51.64,25.06 51.64,26.67 U1.37
VUSB: length 35.6
  Top Layer w0.254: USBC1.B4A9 27.51,39.55 26.94,40.12 26.72,40.12 26.38,40.47 ; 26.38,40.47 26.38,42.53 27.12,43.28 27.12,43.83 27.64,44.35 USBC1.A4B9 ; 26.38,40.47 26.2,40.47 25.69,39.95 25.69,36.96 26.35,36.3 31.44,36.3 ; Q5.1 34.3,24.79 33.1,26 R21.2 33.1,33.21 D6.1 31.44,36.17 31.44,36.3 ; 31.44,36.3 31.44,39.91 31.57,40.05 D1.5
$1N2: length 4.6
  Top Layer w0.225: U8.10 50.6,37.3 C24.2
$1N29: length 21.6
  Bottom Layer w0.254: R4.2 47.16,53.48 36.07,53.48 35.87,53.28 35.87,52.45 38.6,49.71 38.6,46.38 38.5,46.28 U3.6
$1N30: length 8.6
  Bottom Layer w0.254: R5.2 39.47,50.08 39.47,46.31 39.5,46.28 U3.8
$1N46: length 2.9
  Top Layer w0.254: 44.17,42.3 44.86,42.3 45.07,42.51 46.79,42.51 C18.1
$1N48: length 2.8
  Top Layer w0.254: U2.20 38.1,42.8 C19.1
$1N51: length 19.6
  Top Layer w0.254: U2.23 39.48,41.31 39.48,39.8 41.03,38.25 41.82,38.25 41.92,38.35 45.81,38.35 49.47,34.69 49.47,34.04 50.12,33.39 51.23,33.39 51.31,33.31 51.31,31.96 R20.1
$1N52: length 14
  Top Layer w0.254: R19.1 45.98,38.78 41.84,38.78 41.66,38.6 41.18,38.6 40.17,39.62 U2.24
$1N54: length 12.3
  Top Layer w0.254: 2.57,79.88 2.57,74.04 7.18,69.44
$1N55: length 17.6
  Top Layer w0.254: 75.03,67.63 80.63,73.23 80.63,77.89 77.85,80.66 77.85,81.75
$1N56: length 17.8
  Top Layer w0.254: 79.47,3.48 78.55,2.55 74.55,2.55 70.75,6.35 68.45,6.35 66.25,8.55 66.25,9.21 66.98,9.94
$1N57: length 13.6
  Top Layer w0.254: 16.27,9.47 9.83,3.04 LED4.1
$1N72: length 10
  Top Layer w0.254: Q5.3 32,25.74 28.6,25.74 24.74,29.6 Q6.3
$1N85: length 14.4
  Top Layer w0.206: 43.59,29.35 40.45,26.21 C15.1 ; 43.59,29.35 43.25,29.35 ; 43.59,29.35 43.92,29.35 43.92,29.67 43.74,29.85 ; 43.25,29.85 43.74,29.85 ; 43.74,29.85 43.92,29.85 43.92,30.35 43.25,30.35
  Top Layer w0.254: R14.1 37.82,23.83 41.15,23.83 41.22,23.9 41.22,25.18 C15.1
$1N88: length 7.3
  Top Layer w0.215: L1.1 37.15,32.54 39.56,30.13 39.56,29.85 U6.4
$1N89: length 5.3
  Top Layer w0.215: L1.2 39.55,33.58 39.56,33.57 39.56,30.85 U6.2
$1N91: length 15.6
  Top Layer w0.206: 45.47,31.24 45.35,31.35 43.26,31.35 43.26,31.66 42.47,32.45 41.01,32.45 40.26,31.69 U6.1
  Top Layer w0.254: 44.8,25.95 C14.1 ; 44.8,25.95 L2.1 ; 44.8,25.95 44.8,30.4 C13.1 45.47,31.23
$1N130: length 6.2
  Top Layer w0.254: USBC1.A5 29.17,43.2 29.17,46.69 27.91,47.95
$1N131: length 11.2
  Top Layer w0.254: USBC1.B5 27.39,40.2 27.11,40.47 v1(27.11,40.71) ; 27.9,49.45 v1(28.77,48.58)
  Inner1 w0.254: v1(28.77,48.58) 28.77,42.37 v1(27.11,40.71)
$1N143: length 10
  Top Layer w0.254: 22.28,60.99 22.55,61.26 22.55,64.15 18.26,68.43 17.56,68.43
$1N145: length 10.3
  Top Layer w0.254: 20.54,58.43 22.66,58.43 22.68,58.46 22.77,58.46 Q1.1 23.65,59.51 23.21,59.95 23.21,64.94 22.47,65.68
$1N148: length 8.8
  Top Layer w0.254: R11.2 63.28,58.6 61.95,59.93 61.95,61.03 61.47,61.51 ; R7.2 61.03,62.3 61.03,61.95 Q2.1
$1N150: length 7.1
  Top Layer w0.254: 66.24,68.24 66.24,64.94 Q2.3
$1N153: length 7.6
  Top Layer w0.254: R12.2 59.03,19.97 Q3.1 60.64,22.57 60.23,22.57 60.05,22.75 60.05,23.72 59.61,24.16 59.61,24.23 R8.2
$1N155: length 11.2
  Top Layer w0.254: D4.2 65.86,18.74 61.02,23.59 Q3.3
$1N158: length 8.9
  Top Layer w0.254: 21.95,18.76 21.95,19.68 20.14,21.48 20.14,21.53 19.7,21.97 18.69,21.97 17.73,22.93 ; 21.95,18.76 Q4.1 ; 21.95,18.76 21.95,18.68 22.57,18.05 22.57,17.33
$1N160: length 4.7
  Top Layer w0.254: 19.41,18.29 18.87,17.64 16.74,15.51 D5.2

## Text on the board
Top Silkscreen Layer: PAKSHI(DRON)......
